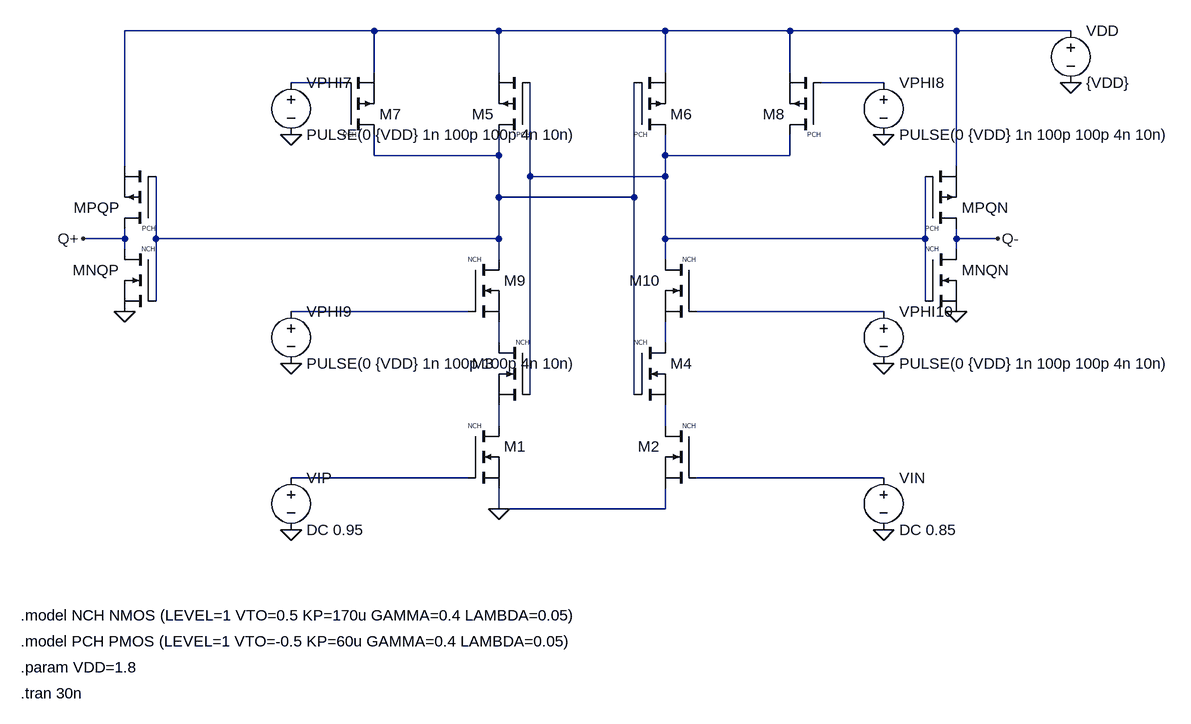
[diagram p0: schematic 5_modified_dynamic_latch.asc]
5_modified_dynamic_latch.asc, the LTspice schematic file:
Version 4
SHEET 1 3000 2000
WIRE -224 320 -160 320
WIRE -160 0 -160 208
WIRE -160 0 224 0
WIRE -160 304 -160 320
WIRE -160 320 -160 336
WIRE -112 224 -112 320
WIRE -112 320 -112 416
WIRE -112 320 416 320
WIRE 96 80 176 80
WIRE 96 432 368 432
WIRE 96 688 368 688
WIRE 224 0 224 64
WIRE 224 0 416 0
WIRE 224 160 224 192
WIRE 224 192 416 192
WIRE 416 0 416 64
WIRE 416 0 672 0
WIRE 416 160 416 192
WIRE 416 192 416 256
WIRE 416 256 416 320
WIRE 416 256 624 256
WIRE 416 320 416 352
WIRE 416 448 416 480
WIRE 416 576 416 608
WIRE 416 704 416 736
WIRE 416 736 672 736
WIRE 464 80 464 224
WIRE 464 224 464 560
WIRE 464 224 672 224
WIRE 624 80 624 256
WIRE 624 256 624 560
WIRE 672 0 672 64
WIRE 672 0 864 0
WIRE 672 160 672 192
WIRE 672 192 672 224
WIRE 672 192 864 192
WIRE 672 224 672 320
WIRE 672 320 672 352
WIRE 672 320 1072 320
WIRE 672 448 672 480
WIRE 672 576 672 608
WIRE 672 704 672 736
WIRE 720 432 1008 432
WIRE 720 688 1008 688
WIRE 864 0 864 64
WIRE 864 0 1120 0
WIRE 864 160 864 192
WIRE 912 80 1008 80
WIRE 1072 224 1072 320
WIRE 1072 320 1072 416
WIRE 1120 0 1120 208
WIRE 1120 0 1296 0
WIRE 1120 304 1120 320
WIRE 1120 320 1120 336
WIRE 1120 320 1184 320
FLAG 1296 80 0
FLAG 96 160 0
FLAG 1008 160 0
FLAG 96 512 0
FLAG 1008 512 0
FLAG -160 432 0
FLAG -224 320 Q+
FLAG 1120 432 0
FLAG 1184 320 Q-
FLAG 416 736 0
FLAG 96 768 0
FLAG 1008 768 0
SYMBOL voltage 1296 -16 R0
SYMATTR InstName VDD
SYMATTR Value {VDD}
SYMBOL pmos 176 160 M180
WINDOW 3 0 0 Left 0
WINDOW 123 0 0 Left 0
SYMATTR InstName M7
SYMATTR Value PCH
SYMATTR SpiceLine l=0.18u w=4u
SYMBOL pmos 464 160 R180
WINDOW 3 0 0 Left 0
WINDOW 123 0 0 Left 0
SYMATTR InstName M5
SYMATTR Value PCH
SYMATTR SpiceLine l=0.18u w=4u
SYMBOL pmos 624 160 M180
WINDOW 3 0 0 Left 0
WINDOW 123 0 0 Left 0
SYMATTR InstName M6
SYMATTR Value PCH
SYMATTR SpiceLine l=0.18u w=4u
SYMBOL pmos 912 160 R180
WINDOW 3 0 0 Left 0
WINDOW 123 0 0 Left 0
SYMATTR InstName M8
SYMATTR Value PCH
SYMATTR SpiceLine l=0.18u w=4u
SYMBOL nmos 368 352 R0
WINDOW 3 0 0 Left 0
WINDOW 123 0 0 Left 0
SYMATTR InstName M9
SYMATTR Value NCH
SYMATTR SpiceLine l=0.18u w=2u
SYMBOL nmos 720 352 M0
WINDOW 3 0 0 Left 0
WINDOW 123 0 0 Left 0
SYMATTR InstName M10
SYMATTR Value NCH
SYMATTR SpiceLine l=0.18u w=2u
SYMBOL voltage 96 64 R0
SYMATTR InstName VPHI7
SYMATTR Value PULSE(0 {VDD} 1n 100p 100p 4n 10n)
SYMBOL voltage 1008 64 R0
SYMATTR InstName VPHI8
SYMATTR Value PULSE(0 {VDD} 1n 100p 100p 4n 10n)
SYMBOL voltage 96 416 R0
SYMATTR InstName VPHI9
SYMATTR Value PULSE(0 {VDD} 1n 100p 100p 4n 10n)
SYMBOL voltage 1008 416 R0
SYMATTR InstName VPHI10
SYMATTR Value PULSE(0 {VDD} 1n 100p 100p 4n 10n)
SYMBOL pmos -112 304 R180
WINDOW 3 0 0 Left 0
WINDOW 123 0 0 Left 0
SYMATTR InstName MPQP
SYMATTR Value PCH
SYMATTR SpiceLine l=0.18u w=4u
SYMBOL nmos -112 336 M0
WINDOW 3 0 0 Left 0
WINDOW 123 0 0 Left 0
SYMATTR InstName MNQP
SYMATTR Value NCH
SYMATTR SpiceLine l=0.18u w=2u
SYMBOL pmos 1072 304 M180
WINDOW 3 0 0 Left 0
WINDOW 123 0 0 Left 0
SYMATTR InstName MPQN
SYMATTR Value PCH
SYMATTR SpiceLine l=0.18u w=4u
SYMBOL nmos 1072 336 R0
WINDOW 3 0 0 Left 0
WINDOW 123 0 0 Left 0
SYMATTR InstName MNQN
SYMATTR Value NCH
SYMATTR SpiceLine l=0.18u w=2u
SYMBOL nmos 464 480 M0
WINDOW 3 0 0 Left 0
WINDOW 123 0 0 Left 0
SYMATTR InstName M3
SYMATTR Value NCH
SYMATTR SpiceLine l=0.18u w=2u
SYMBOL nmos 624 480 R0
WINDOW 3 0 0 Left 0
WINDOW 123 0 0 Left 0
SYMATTR InstName M4
SYMATTR Value NCH
SYMATTR SpiceLine l=0.18u w=2u
SYMBOL nmos 368 608 R0
WINDOW 3 0 0 Left 0
WINDOW 123 0 0 Left 0
SYMATTR InstName M1
SYMATTR Value NCH
SYMATTR SpiceLine l=0.18u w=2u
SYMBOL nmos 720 608 M0
WINDOW 3 0 0 Left 0
WINDOW 123 0 0 Left 0
SYMATTR InstName M2
SYMATTR Value NCH
SYMATTR SpiceLine l=0.18u w=2u
SYMBOL voltage 96 672 R0
SYMATTR InstName VIP
SYMATTR Value DC 0.95
SYMBOL voltage 1008 672 R0
SYMATTR InstName VIN
SYMATTR Value DC 0.85
TEXT -320 900 Left 2 !.model NCH NMOS (LEVEL=1 VTO=0.5 KP=170u GAMMA=0.4 LAMBDA=0.05)
TEXT -320 940 Left 2 !.model PCH PMOS (LEVEL=1 VTO=-0.5 KP=60u GAMMA=0.4 LAMBDA=0.05)
TEXT -320 980 Left 2 !.param VDD=1.8
TEXT -320 1020 Left 2 !.tran 30n

The netlist it stands for:
* 5_modified_dynamic_latch.asc
VDD N001 0 {VDD}
M7 N002 N003 N001 N001 PCH l=0.18u w=4u
M5 N002 N008 N001 N001 PCH l=0.18u w=4u
M6 N008 N002 N001 N001 PCH l=0.18u w=4u
M8 N008 N013 N001 N001 PCH l=0.18u w=4u
M9 N002 N004 N006 N006 NCH l=0.18u w=2u
M10 N008 N011 N009 N009 NCH l=0.18u w=2u
VPHI7 N003 0 PULSE(0 {VDD} 1n 100p 100p 4n 10n)
VPHI8 N013 0 PULSE(0 {VDD} 1n 100p 100p 4n 10n)
VPHI9 N004 0 PULSE(0 {VDD} 1n 100p 100p 4n 10n)
VPHI10 N011 0 PULSE(0 {VDD} 1n 100p 100p 4n 10n)
MPQP Q+ N002 N001 N001 PCH l=0.18u w=4u
MNQP Q+ N002 0 0 NCH l=0.18u w=2u
MPQN Q- N008 N001 N001 PCH l=0.18u w=4u
MNQN Q- N008 0 0 NCH l=0.18u w=2u
M3 N006 N008 N007 N007 NCH l=0.18u w=2u
M4 N009 N002 N010 N010 NCH l=0.18u w=2u
M1 N007 N005 0 0 NCH l=0.18u w=2u
M2 N010 N012 0 0 NCH l=0.18u w=2u
VIP N005 0 DC 0.95
VIN N012 0 DC 0.85
.model NMOS NMOS
.model PMOS PMOS
.lib standard.mos
.model NCH NMOS (LEVEL=1 VTO=0.5 KP=170u GAMMA=0.4 LAMBDA=0.05)
.model PCH PMOS (LEVEL=1 VTO=-0.5 KP=60u GAMMA=0.4 LAMBDA=0.05)
.param VDD=1.8
.tran 30n
.backanno
.end